# Altium schematic sheet POWER_SUPPLY.SchDoc
size A3; SheetNumber: 2; SheetTotal: 9
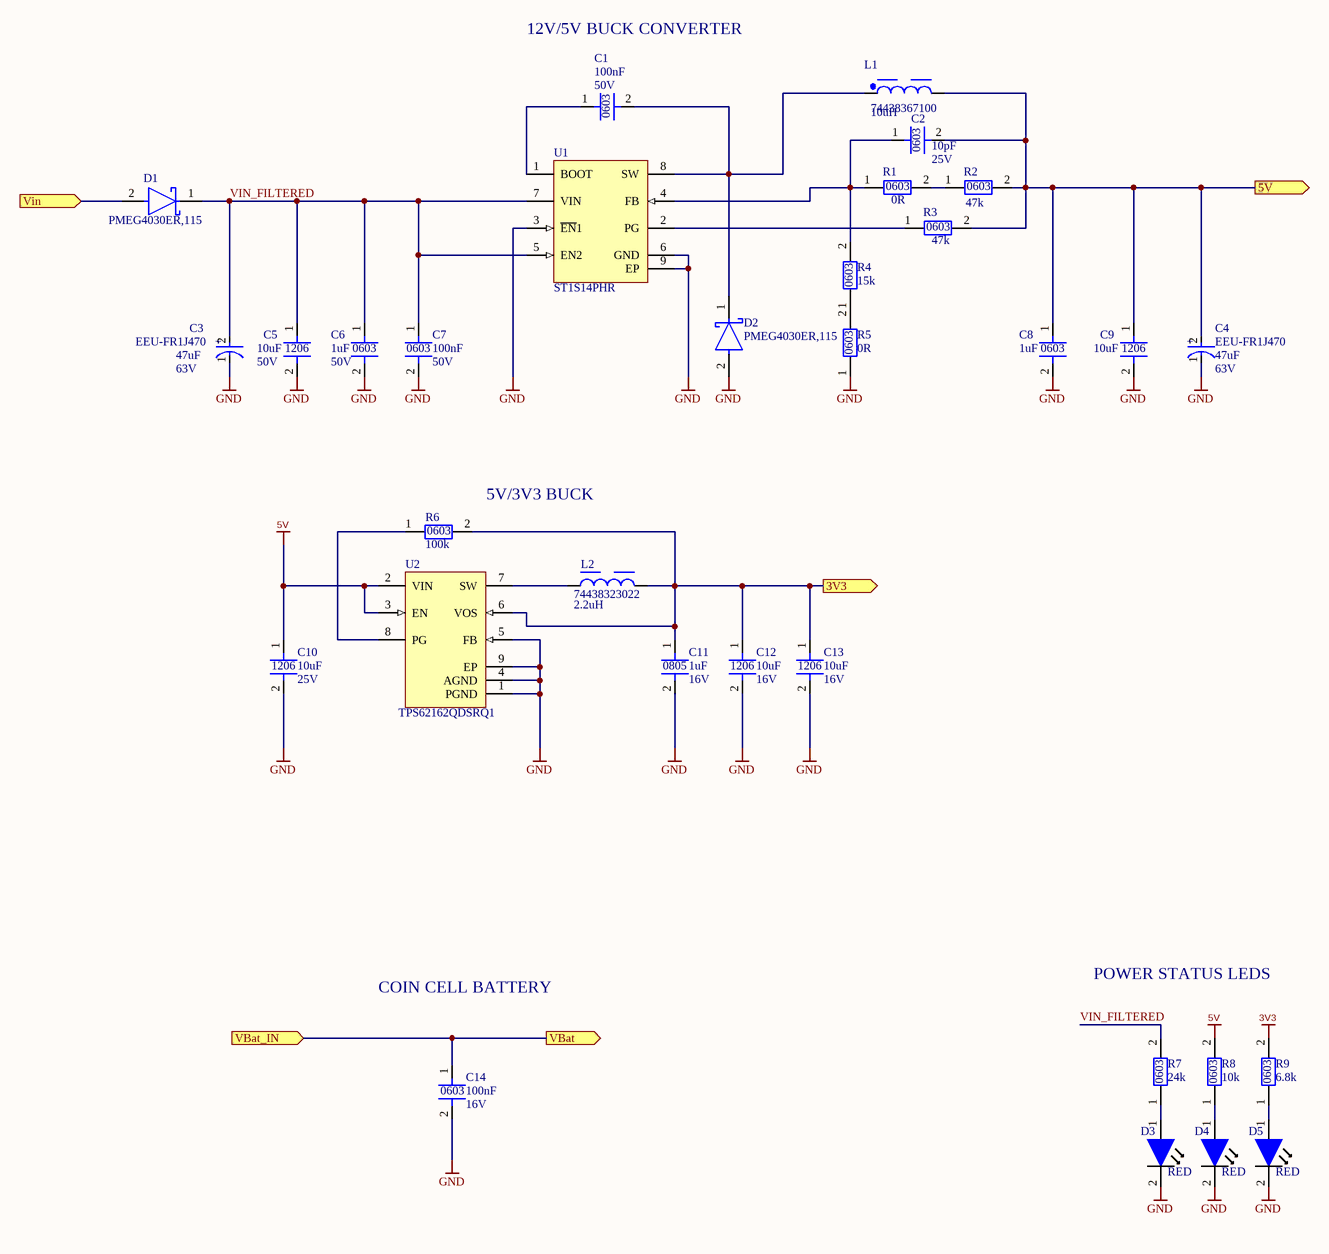
[diagram p0: POWER_SUPPLY.SchDoc]

## Parts
C1  SMD 0603 Capacitor  [CAPACITOR_SMD_0603]  (value not drawn)
C2  SMD 0603 Capacitor  [CAPACITOR_SMD_0603]  (value not drawn)
C3  EEU-FR1J470  [FP-EEU-FR1J470-MFG]
C4  EEU-FR1J470  [FP-EEU-FR1J470-MFG]
C5  SMD 1206 Capacitor  [CAPACITOR_SMD_1206]  (value not drawn)
C6  SMD 0603 Capacitor  [CAPACITOR_SMD_0603]  (value not drawn)
C7  SMD 0603 Capacitor  [CAPACITOR_SMD_0603]  (value not drawn)
C8  SMD 0603 Capacitor  [CAPACITOR_SMD_0603]  (value not drawn)
C9  SMD 1206 Capacitor  [CAPACITOR_SMD_1206]  (value not drawn)
C10  SMD 1206 Capacitor  [CAPACITOR_SMD_1206]  (value not drawn)
C11  SMD 0805 Capacitor  [CAPACITOR_SMD_0805_IPC]  (value not drawn)
C12  SMD 1206 Capacitor  [CAPACITOR_SMD_1206]  (value not drawn)
C13  SMD 1206 Capacitor  [CAPACITOR_SMD_1206]  (value not drawn)
C14  SMD 0603 Capacitor  [CAPACITOR_SMD_0603]  (value not drawn)
D1  PMEG4030ER,115  [FP-SOD123W-MFG]
D2  PMEG4030ER,115  [FP-SOD123W-MFG]
D3  SMD LED 0603  [0603 LED]  (value not drawn)
D4  SMD LED 0603  [0603 LED]  (value not drawn)
D5  SMD LED 0603  [0603 LED]  (value not drawn)
L1  74438367100  [WE-MAPI_5030]
L2  74438323022  [WE-MAPI_2510]
R1  SMD 0603 Resistor  [RESISTOR_SMD_0603]  (value not drawn)
R2  SMD 0603 Resistor  [RESISTOR_SMD_0603]  (value not drawn)
R3  SMD 0603 Resistor  [RESISTOR_SMD_0603]  (value not drawn)
R4  SMD 0603 Resistor  [RESISTOR_SMD_0603]  (value not drawn)
R5  SMD 0603 Resistor  [RESISTOR_SMD_0603]  (value not drawn)
R6  SMD 0603 Resistor  [RESISTOR_SMD_0603]  (value not drawn)
R7  SMD 0603 Resistor  [RESISTOR_SMD_0603]  (value not drawn)
R8  SMD 0603 Resistor  [RESISTOR_SMD_0603]  (value not drawn)
R9  SMD 0603 Resistor  [RESISTOR_SMD_0603]  (value not drawn)
U1  ST1S14PHR  [HSO-8_L]
U2  TPS62162QDSRQ1  [DSG0008A_V]

## Ports
3V3 (out, see MAIN_SCHEMATIC[3A]), 5V (out, see MAIN_SCHEMATIC[3A]), VBat (out, see MAIN_SCHEMATIC[3A]), VBat_IN (in, see MAIN_SCHEMATIC[2A]), Vin (in, see MAIN_SCHEMATIC[2A])

## Nets
3V3: R9.2
5V: C10.1 R8.2 U2.2(VIN) U2.3(EN)
GND: C3.1(C) C4.1(C) C5.2 C6.2 C7.2 C8.2 C9.2 C10.2 C11.2 C12.2 C13.2 C14.2 D2.2(A) D3.2 D4.2 D5.2 R5.1 U1.3(~{EN}1) U1.6(GND) U1.9(EP) U2.1(PGND) U2.4(AGND) U2.5(FB) U2.9(EP)
3V3: C11.1 C12.1 C13.1 L2.2 R6.2 U2.6(VOS) ; port 3V3  [a separate net that carries the same name]
5V: C2.2 C4.2(A) C8.1 C9.1 L1.2 R2.2 R3.2 ; port 5V  [a separate net that carries the same name]
VBat: C14.1 ; port VBat, port VBat_IN
Vin: D1.2(A) ; port Vin
VIN_FILTERED: C3.2(A) C5.1 C6.1 C7.1 D1.1(C) R7.2 U1.5(EN2) U1.7(VIN)
NetC1_1: C1.1 U1.1(BOOT)
NetC1_2: C1.2 D2.1(C) L1.1 U1.8(SW)
NetC2_1: C2.1 R1.1 R4.2 U1.4(FB)
NetD3_1: D3.1 R7.1
NetD4_1: D4.1 R8.1
NetD5_1: D5.1 R9.1
NetL2_1: L2.1 U2.7(SW)
NetR1_2: R1.2 R2.1
NetR3_1: R3.1 U1.2(PG)
NetR4_1: R4.1 R5.2
NetR6_1: R6.1 U2.8(PG)

## Notes on the sheet
- 12V/5V BUCK CONVERTER
- (near C1) 100nF
- (near C1) 50V
- 10uH
- (near C2) 10pF
- (near C2) 25V
- (near R2) 47k
- (near R1) 0R
- (near R3) 47k
- (near R4) 15k
- (near C3) 47uF
- (near C3) 63V
- 10uF
- 50V
- (near C6) 1uF
- (near C6) 50V
- (near C7) 100nF
- (near C7) 50V
- (near R5) 0R
- (near C8) 1uF
- (near C9) 10uF
- (near C4) 47uF
- (near C4) 63V
- (near R6) 5V/3V3 BUCK
- (near R6) 100k
- (near L2) 2.2uH
- (near C10) 10uF
- (near C10) 25V
- (near C11) 1uF
- (near C11) 16V
- (near C12) 10uF
- (near C12) 16V
- (near C13) 10uF
- (near C13) 16V
- COIN CELL BATTERY
- POWER STATUS LEDS
- (near C14) 100nF
- (near C14) 16V
- (near R7) 24k
- (near R8) 10k
- (near R9) 6.8k
- (near D3) RED
- (near D4) RED
- (near D5) RED
- (in symbol CMP-05427-000066-1) +
- (in symbol SMD 0603 Capacitor) 0603
- (in symbol SMD 0603 Resistor) 0603
- (in symbol SMD 0805 Capacitor) 0805
- (in symbol SMD 1206 Capacitor) 1206

## Library data of the parts
C1 C2 C6-C8 C14 = SMD 0603 Capacitor: 0603 capacitor
C3 C4 = CMP-05427-000066-1: CAP ALUM 47UF 20% 63V RADIAL; ESR (Equivalent Series Resistance): 210mR; Lead Diameter: 0.5mm; Life (Hours): 5000Hour; Ripple Current (AC): 284mA; Height - Seated (Max): 0.5inch; Radiation Hardening: No; Termination: Radial; Contact Plating: Tin; Length: 11.2mm; Tolerance: 20%; Voltage: 63V; Max Operating Temperature: 105°C; Construction: Cylindrical; Lead Free: Lead Free; Series: FR; Mount: Through Hole; Lead Pitch: 2.5mm; Capacitance: 47uF; Case/Package: Radial; Voltage Rating (DC): 63V; Diameter: 6.3mm; Impedance: 210mR; RoHS Compliant: Yes; Height: 11.2mm; REACH SVHC: No SVHC; Package Quantity: 200; Ripple Current: 284mA; Voltage Rating: 63V; Packaging: Bulk; Min Operating Temperature: -40°C
C5 C9 C10 C12 C13 = SMD 1206 Capacitor: 1206 capacitor
D1 D2 = CMP-14398-000026-1: DIODE SCHOTTKY 40V 3A SOD123W; RoHS Compliant: Yes
D3-D5 = SMD LED 0603: 0603 LED
L1 = CMP-03913-130924348-3: Power Inductor, 10Uh, Shielded, 4.8A Rohs Compliant: Yes; DC Resistance (DCR): 61mΩ; Current Rating: 3.3A; Inductance: 10µH; Min Operating Temperature: -40°C; Ambient Temperature Range High: 85°C; Max Operating Temperature: 125°C; Width: 5.4mm; Length: 5.4mm; RoHS: Compliant; Height: 3.1mm; Ambient Temperature Range Low: -40°C
L2 = CMP-1411-00006-4: Inductor Power Shielded Wirewound 2.2uH 20% 100KHz Powdered Iron 1.3A 176mOhm DCR 1008 T/R; Saturation Current: 2.5A; Series Resistance: 147mΩ; Self Resonant Frequency: 60MHz; Core Material: Composite, Ferrite, Metal; Inductance: 2.2µH; Height - Seated (Max): 990.6µm; Tolerance: 20%; Case Code (Metric): 2520; Min Operating Temperature: -40°C; Termination: SMD/SMT; DC Resistance (DCR): 147mΩ; RMS Current (Irms): 1.3A; Width: 2mm; Height: 1mm; RoHS: Compliant; Ambient Temperature Range Low: -40°C; Mount: Surface Mount; Test Frequency: 100kHz; Max Operating Temperature: 125°C; Depth: 2mm; Case Code (Imperial): 1008; Shielding: Shielded; Max DC Current: 1.3A; Case/Package: SMD/SMT; Ambient Temperature Range High: 85°C; Inductance Tolerance: 20%; REACH SVHC: Unknown; Weight: 32.006612mg; Current Rating: 1.3A; Number of Pins: 2; Length: 2.5mm
R1-R9 = SMD 0603 Resistor: 0603 resistor
U1 = CMP-0240-00043-1: Up to 3 A step down switching regulator, 8-Pin HSOP; ComponentLink1Description: Manufacturer URL; PackageVersion: 2007; ComponentLink2URL: http://www.st.com/internet/com/TECHNICAL_RESOURCES/TECHNICAL_LITERATURE/DATASHEET/CD00285678.pdf; DatasheetVersion: Oct-2010; ComponentLink2Description: Datasheet; PackageReference: HSO-8; PackageDescription: 8-Pin Small Outline Integrated Circuit 1.27 mm Pitch; ComponentLink1URL: http://www.st.com
U2 = CMP-0323-00319-3: Buck Step Down Regulator with 3 to 17 V Input and 3.3 V Output, -40 to 85 degC, 8-Pin WSON (DSG), Green (RoHS & no Sb/Br); Manufacturer: Texas Instruments; PartNumber: TPS62162DSGT; Synchronous Rectification: TRUE; Iq(Typ)(mA): 0.017; Switch Current Limit(Typ)(A): 1.8; Regulated Outputs(#): 1; Duty Cycle(Max)(%): 100; SubFamily: Step-Down Regulator; Preset Vout(V): 3.3; Rating: Catalog; Vin(Max)(V): 17; Vin(Min)(V): 3; ComponentLink2Description: Package Specification; PackageVersion: revB, Oct-2010; DatasheetVersion: SLVSAM2A; ComponentLink1Description: Datasheet; PackageDescription: 8-Pin Plastic Small Outline No-Lead, 2 x 2 x 0.8 mm Body, 0.5 mm Pitch, Exposed Pad; ComponentLink2URL: http://www.ti.com/litv/pdf/mpds308a; Code_JEDEC: MO-229; ComponentLink3URL: Samples URL:http://www.ti.com/product/tps54611#samples; Mounting Technology: Surface Mount; Eco-Plan: Green (RoHS & no Sb/Br); Vout(Min)(V): 3.3; PackageReference: DSG0008A; Topology: Buck; ComponentLink1URL: http://www.ti.com/general/docs/lit/getliterature.tsp?genericPartNumber=TPS62162&fileType=pdf; Vout(Max)(V): 3.3; Iout(Max)(A): 1; ComponentLink3Description: URL Link1
C11 = SMD 0805 Capacitor: Capacitance: *